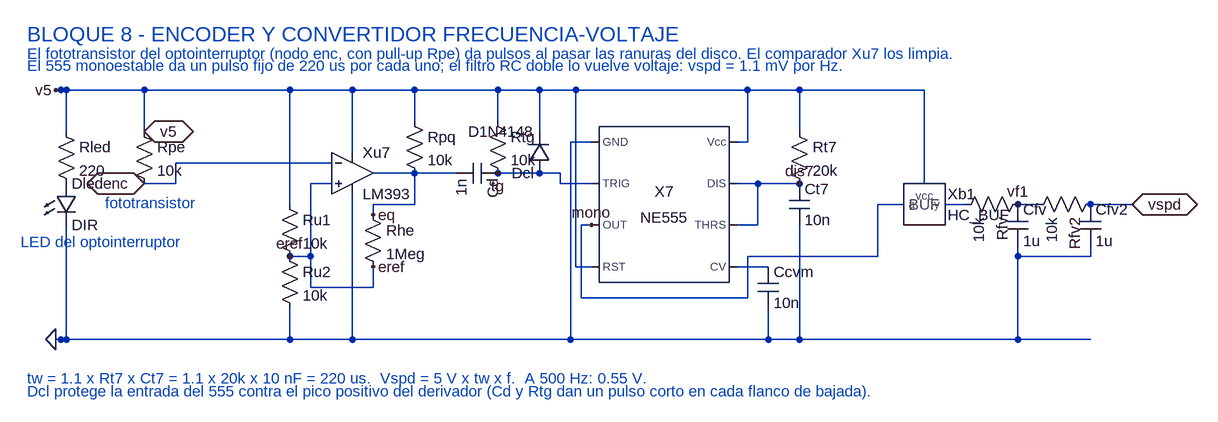
[diagram p0: schematic BLOQUE_ENCODER_FV.asc]
BLOQUE_ENCODER_FV.asc, the LTspice schematic file:
Version 4
SHEET 1 1700 800
WIRE 0 80 48 80
WIRE 48 80 48 48
WIRE 48 48 288 48
WIRE 224 192 256 192
WIRE 256 192 256 80
WIRE 256 80 288 80
WIRE 352 64 416 64
WIRE 416 64 480 64
WIRE 352 208 352 240
WIRE 352 240 256 240
WIRE 256 240 256 192
WIRE 544 64 608 64
WIRE 608 64 640 64
WIRE 640 64 640 80
WIRE 640 80 688 80
WIRE 912 80 944 80
WIRE 944 80 944 144
WIRE 944 144 912 144
WIRE 944 80 1008 80
WIRE 912 208 960 208
WIRE 1168 112 1128 112
WIRE 1232 112 1264 112
WIRE 1344 112 1376 112
WIRE 1456 112 1520 112
WIRE 416 64 416 112
WIRE 416 112 352 112
WIRE 352 112 352 128
WIRE 1128 112 1128 192
WIRE 1128 192 928 192
WIRE 928 192 928 256
WIRE 928 256 672 256
WIRE 672 256 672 144
WIRE 672 144 688 144
WIRE -136 -64 1200 -64
WIRE -136 -64 -128 -64
WIRE 416 -16 416 -64
WIRE 544 -16 544 -64
WIRE -120 0 -120 -64
WIRE 0 0 0 -64
WIRE 608 0 608 -64
WIRE 1008 0 1008 -64
WIRE 912 16 928 16
WIRE 928 16 928 -64
WIRE 320 32 320 -64
WIRE 1200 80 1200 -64
WIRE 224 112 224 -64
WIRE 688 208 664 208
WIRE 664 208 664 -64
WIRE -136 320 1456 320
WIRE -136 320 -128 320
WIRE 224 272 224 320
WIRE 960 272 960 320
WIRE 1344 176 1344 320
WIRE 1456 176 1456 192
WIRE 1456 192 1344 192
WIRE -120 144 -120 320
WIRE 1008 144 1008 320
WIRE 320 96 320 320
WIRE 688 16 656 16
WIRE 656 16 656 320
FLAG 0 0 v5
FLAG 0 80 enc
FLAG 224 192 eref
FLAG 352 128 eq
FLAG 352 208 eref
FLAG 544 64 tg
FLAG 688 144 mono
FLAG 1008 80 dis7
FLAG 1344 112 vf1
FLAG 1520 112 vspd
FLAG -136 -64 v5
FLAG -136 320 0
IOPIN 0 0 BiDir
IOPIN 0 80 BiDir
IOPIN 1520 112 BiDir
SYMBOL res -136 -16 R0
SYMATTR InstName Rled
SYMATTR Value 220
SYMBOL LED -136 80 R0
SYMATTR InstName Dled
SYMATTR Value DIR
SYMBOL res -16 -16 R0
SYMATTR InstName Rpe
SYMATTR Value 10k
SYMBOL OpAmps\opamp2 320 0 R0
SYMATTR InstName Xu7
SYMATTR Value LM393
SYMBOL res 208 96 R0
SYMATTR InstName Ru1
SYMATTR Value 10k
SYMBOL res 208 176 R0
SYMATTR InstName Ru2
SYMATTR Value 10k
SYMBOL res 400 -32 R0
SYMATTR InstName Rpq
SYMATTR Value 10k
SYMBOL res 336 112 R0
SYMATTR InstName Rhe
SYMATTR Value 1Meg
SYMBOL cap 544 48 R90
SYMATTR InstName Cd
SYMATTR Value 1n
SYMBOL res 528 -32 R0
SYMATTR InstName Rtg
SYMATTR Value 10k
SYMBOL diode 624 64 R180
SYMATTR InstName Dcl
SYMATTR Value D1N4148
SYMBOL Misc\NE555 800 112 R0
SYMATTR InstName X7
SYMATTR Value NE555
SYMBOL res 992 -16 R0
SYMATTR InstName Rt7
SYMATTR Value 20k
SYMBOL cap 992 80 R0
SYMATTR InstName Ct7
SYMATTR Value 10n
SYMBOL cap 944 208 R0
SYMATTR InstName Ccvm
SYMATTR Value 10n
SYMBOL HC_BUF 1200 112 R0
SYMATTR InstName Xb1
SYMATTR Value HC_BUF
SYMBOL res 1360 96 R90
SYMATTR InstName Rfv
SYMATTR Value 10k
SYMBOL cap 1328 112 R0
SYMATTR InstName Cfv
SYMATTR Value 1u
SYMBOL res 1472 96 R90
SYMATTR InstName Rfv2
SYMATTR Value 10k
SYMBOL cap 1440 112 R0
SYMATTR InstName Cfv2
SYMATTR Value 1u
TEXT -180 -150 Left 3 ;BLOQUE 8 - ENCODER Y CONVERTIDOR FRECUENCIA-VOLTAJE
TEXT -180 -120 Left 2 ;El fototransistor del optointerruptor (nodo enc, con pull-up Rpe) da pulsos al pasar las ranuras del disco. El comparador Xu7 los limpia.
TEXT -180 -102 Left 2 ;El 555 monoestable da un pulso fijo de 220 us por cada uno; el filtro RC doble lo vuelve voltaje: vspd = 1.1 mV por Hz.
TEXT -190 170 Left 2 ;LED del optointerruptor
TEXT -60 110 Left 2 ;fototransistor
TEXT -180 380 Left 2 ;tw = 1.1 x Rt7 x Ct7 = 1.1 x 20k x 10 nF = 220 us.  Vspd = 5 V x tw x f.  A 500 Hz: 0.55 V.
TEXT -180 400 Left 2 ;Dcl protege la entrada del 555 contra el pico positivo del derivador (Cd y Rtg dan un pulso corto en cada flanco de bajada).

The netlist it stands for:
* BLOQUE_ENCODER_FV.asc
Rled v5 P001 220
Dled P001 0 DIR
Rpe v5 enc 10k
XXu7 eref enc v5 0 eq LM393  ; pins In+ In- V+ V- OUT
Ru1 v5 eref 10k
Ru2 eref 0 10k
Rpq v5 eq 10k
Rhe eq eref 1Meg
Cd tg eq 1n
Rtg v5 tg 10k
Dcl tg v5 D1N4148
XX7 0 tg mono v5 N001 dis7 dis7 v5 NE555  ; pins GND TRIG OUT RST CV THRS DIS Vcc
Rt7 v5 dis7 20k
Ct7 dis7 0 10n
Ccvm N001 0 10n
XXb1 mono N002 v5 HC_BUF  ; pins a y vcc
Rfv vf1 N002 10k
Cfv vf1 0 1u
Rfv2 vspd vf1 10k
Cfv2 vspd 0 1u
.model D D
.lib standard.dio
* BLOQUE 8 - ENCODER Y CONVERTIDOR FRECUENCIA-VOLTAJE
* El fototransistor del optointerruptor (nodo enc, con pull-up Rpe) da pulsos al pasar las ranuras del disco. El comparador Xu7 los limpia.
* El 555 monoestable da un pulso fijo de 220 us por cada uno; el filtro RC doble lo vuelve voltaje: vspd = 1.1 mV por Hz.
* LED del optointerruptor
* fototransistor
* tw = 1.1 x Rt7 x Ct7 = 1.1 x 20k x 10 nF = 220 us.  Vspd = 5 V x tw x f.  A 500 Hz: 0.55 V.
* Dcl protege la entrada del 555 contra el pico positivo del derivador (Cd y Rtg dan un pulso corto en cada flanco de bajada).
.lib NE555.sub
.backanno
.end